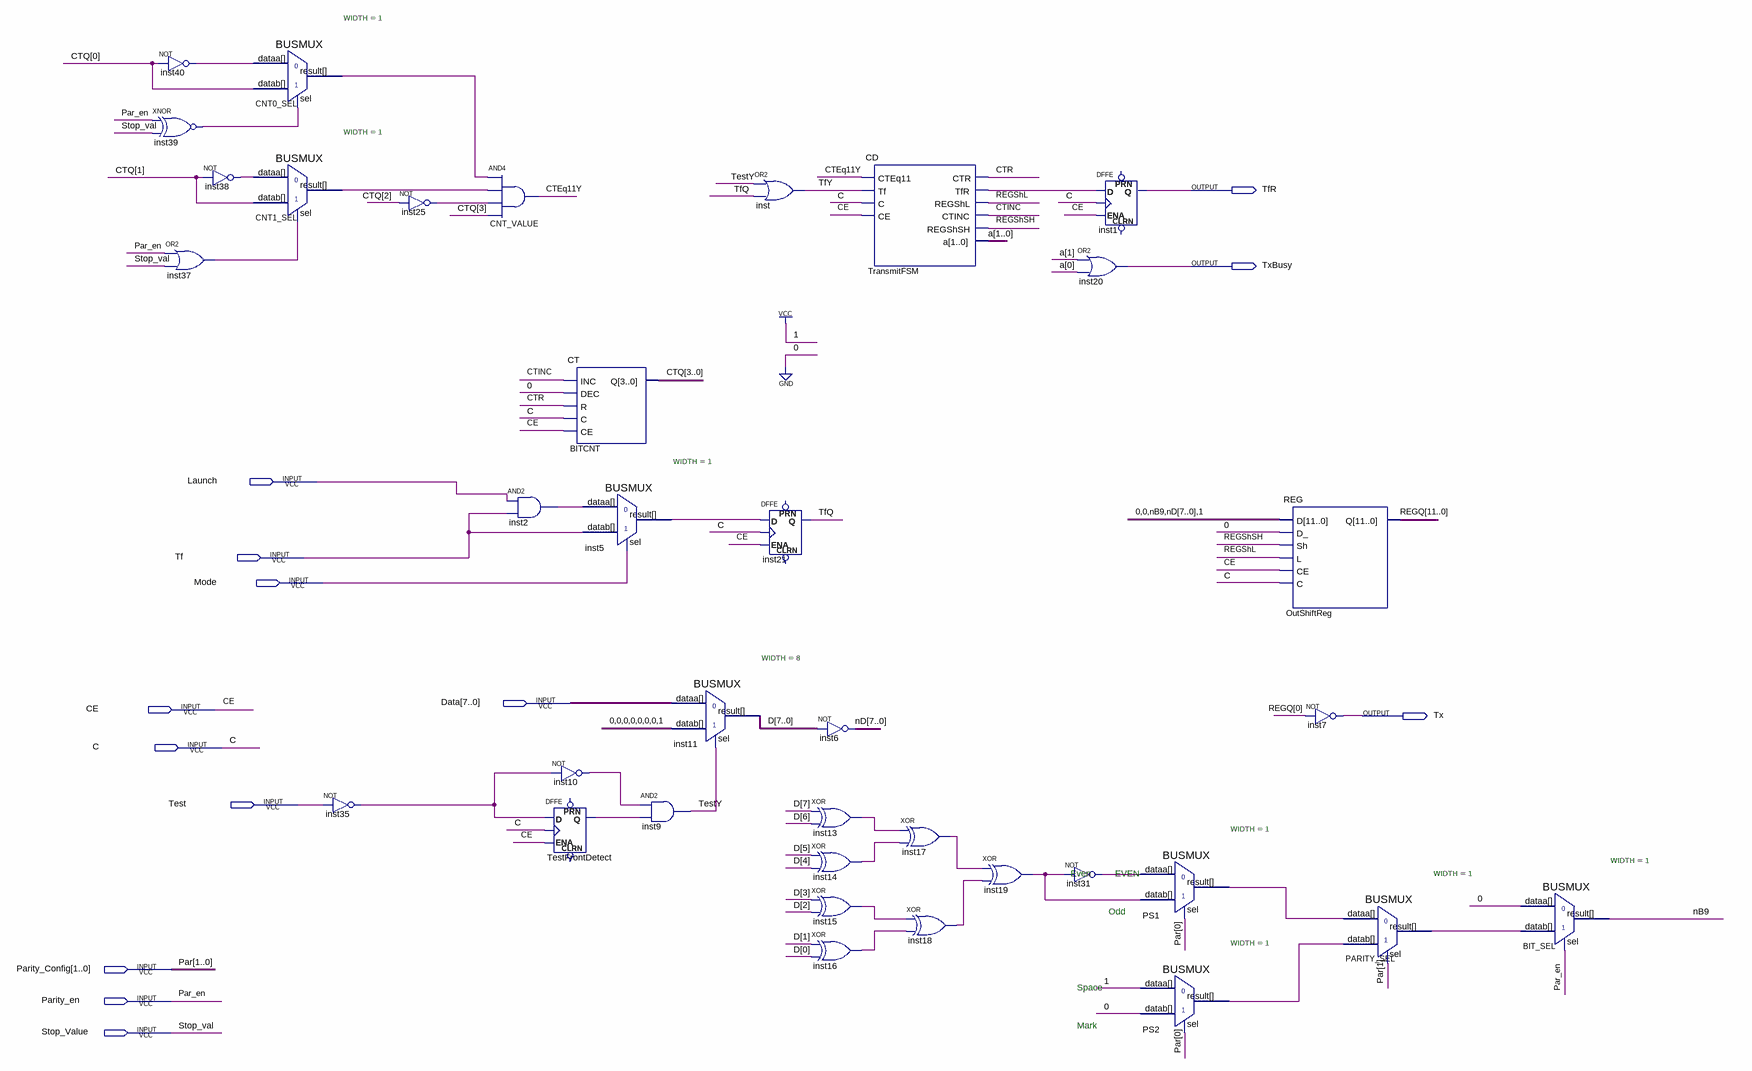
[diagram p0: schematic sheet]
// Quartus schematic Trans.bdf as structural Verilog: 36 symbols, 13 pins
module Trans (
  input  Launch,
  input  Tf,
  input  Mode,
  input  [7:0] Data,
  input  CE,
  input  C,
  input  Test,
  input  [1:0] Parity_Config,
  input  Parity_en,
  input  Stop_Value,
  output TfR,
  output TxBusy,
  output Tx
);

  wire CNT0_SEL_result, CNT1_SEL_result, CTEq11Y, CTINC, CTR, inst2_out, inst5_result, inst10_out,
       inst13_out, inst14_out, inst15_out, inst16_out, inst17_out, inst18_out, inst19_out, inst25_out,
       inst31_out, inst35_out, inst37_out, inst38_out, inst39_out, inst40_out, nB9, PARITY_SEL_result,
       PS1_result, PS2_result, REGShL, REGShSH, TestFrontDetect_q, TestY, TfQ, TfY, TransmitFSM_tfr;
  wire [1:0] a;
  wire [3:0] CTQ;
  wire [7:0] D, nD;
  wire [11:0] REGQ;

  xnor inst39 (inst39_out, Parity_en, Stop_Value);
  not inst40 (inst40_out, CTQ[0]);
  not inst38 (inst38_out, CTQ[1]);
  or inst37 (inst37_out, Parity_en, Stop_Value);
  BUSMUX #(.WIDTH(1)) CNT0_SEL (.datab(CTQ[0]), .sel(inst39_out), .dataa(inst40_out), .result(CNT0_SEL_result));
  BUSMUX #(.WIDTH(1)) CNT1_SEL (.datab(CTQ[1]), .sel(inst37_out), .dataa(inst38_out), .result(CNT1_SEL_result));
  not inst35 (inst35_out, Test);
  not inst25 (inst25_out, CTQ[2]);
  and CNT_VALUE (CTEq11Y, CNT0_SEL_result, CNT1_SEL_result, inst25_out, CTQ[3]);
  and inst2 (inst2_out, Launch, Tf);
  not inst10 (inst10_out, inst35_out);
  DFFE TestFrontDetect (.D(inst35_out), .CLK(C), .ENA(CE), .Q(TestFrontDetect_q));  // open: PRN, CLRN
  CT BITCNT (.INC(CTINC), .DEC(1'b0), .R(CTR), .C(C), .CE(CE), .Q(CTQ));
  BUSMUX #(.WIDTH(1)) inst5 (.datab(Tf), .sel(Mode), .dataa(inst2_out), .result(inst5_result));
  and inst9 (TestY, inst10_out, TestFrontDetect_q);
  BUSMUX #(.WIDTH(8)) inst11 (.datab(8'b00000001), .sel(TestY), .dataa(Data), .result(D));
  or inst (TfY, TestY, TfQ);
  DFFE inst21 (.D(inst5_result), .CLK(C), .ENA(CE), .Q(TfQ));  // open: PRN, CLRN
  xor inst13 (inst13_out, D[7], D[6]);
  xor inst14 (inst14_out, D[5], D[4]);
  xor inst15 (inst15_out, D[3], D[2]);
  xor inst16 (inst16_out, D[1], D[0]);
  CD TransmitFSM (
    .CTEq11(CTEq11Y), .Tf(TfY), .C(C), .CE(CE), .CTR(CTR), .TfR(TransmitFSM_tfr), .REGShL(REGShL),
    .CTINC(CTINC), .REGShSH(REGShSH), .a(a));
  assign nD = ~D;  // NOT inst6, 8 bits wide
  xor inst17 (inst17_out, inst13_out, inst14_out);
  xor inst18 (inst18_out, inst15_out, inst16_out);
  xor inst19 (inst19_out, inst17_out, inst18_out);
  not inst31 (inst31_out, inst19_out);
  DFFE inst1 (.D(TransmitFSM_tfr), .CLK(C), .ENA(CE), .Q(TfR));  // open: PRN, CLRN
  or inst20 (TxBusy, a[1], a[0]);
  BUSMUX #(.WIDTH(1)) PS1 (.datab(inst19_out), .sel(Parity_Config[0]), .dataa(inst31_out), .result(PS1_result));
  BUSMUX #(.WIDTH(1)) PS2 (.datab(1'b0), .sel(Parity_Config[0]), .dataa(1'b1), .result(PS2_result));
  REG OutShiftReg (.D({2'b00, nB9, nD, 1'b1}), .D_(1'b0), .Sh(REGShSH), .L(REGShL), .CE(CE), .C(C), .Q(REGQ));
  not inst7 (Tx, REGQ[0]);
  BUSMUX #(.WIDTH(1)) PARITY_SEL (
    .datab(PS2_result), .sel(Parity_Config[1]), .dataa(PS1_result), .result(PARITY_SEL_result));
  BUSMUX #(.WIDTH(1)) BIT_SEL (.datab(PARITY_SEL_result), .sel(Parity_en), .dataa(1'b0), .result(nB9));

  // Other names for the same wires on the sheet: Par[1:0] = Parity_Config; Par_en = Parity_en; Stop_val = Stop_Value

  // Notes on the sheet:
  //   Even
  //   EVEN
  //   Odd
  //   Space
  //   Mark
endmodule
